# Altium schematic sheet 48MHz_TCXO.SchDoc
size A2; SheetNumber: 2; SheetTotal: 3
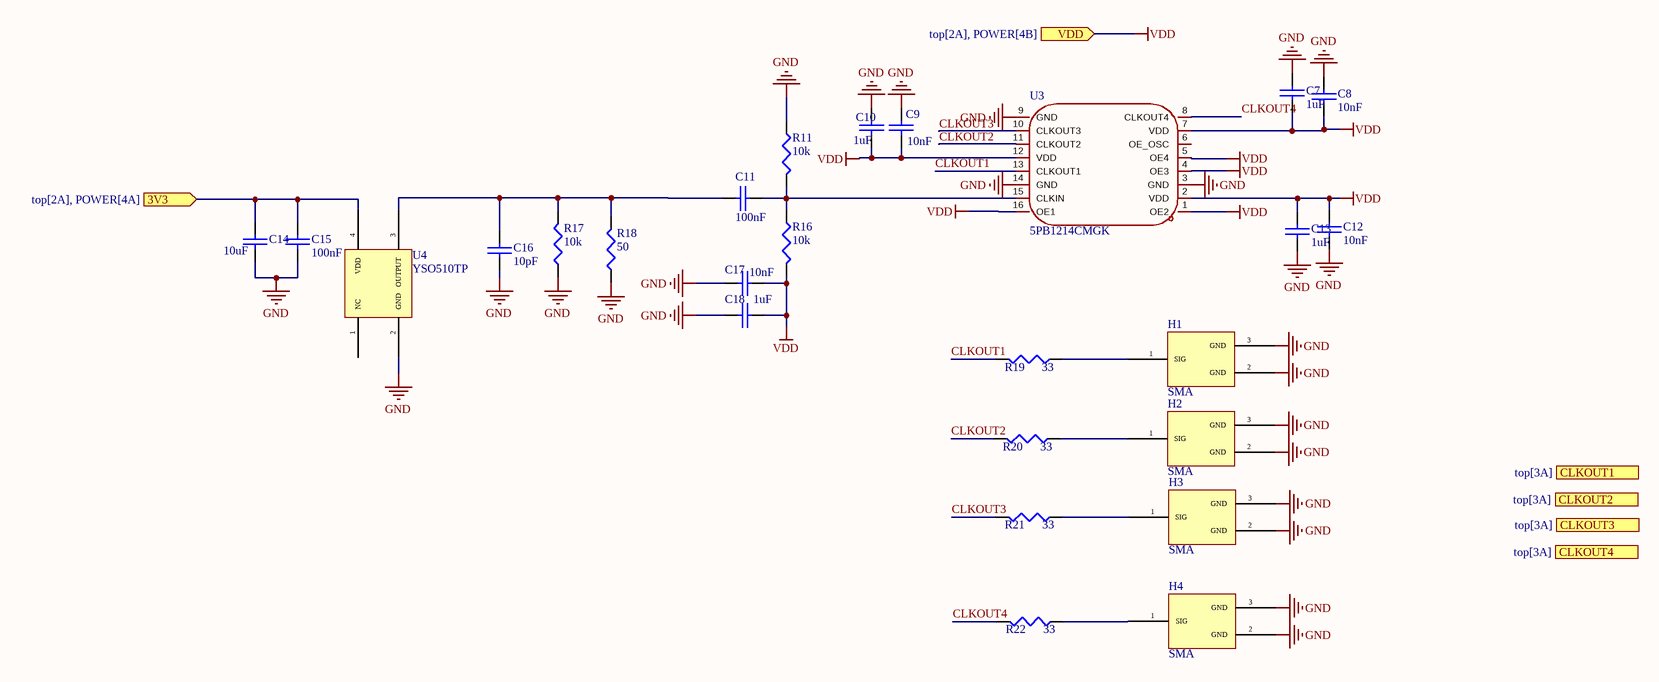
[diagram p0: 48MHz_TCXO.SchDoc]

## Parts
C7  1uF  [0603_Z]
C8  10nF  [0402_Z]
C9  10nF  [0402_Z]
C10  1uF  [0402_Z]
C11  100nF  [0402_Z]
C12  10nF  [0402_Z]
C13  1uF  [0402_Z]
C14  10uF  [0402_Z]
C15  100nF  [0402_Z]
C16  10pF  [0402_Z]
C17  10nF  [0402_Z]
C18  1uF  [0402_Z]
H1  SMA  [SMA-SMD]
H2  SMA  [SMA-SMD]
H3  SMA  [SMA-SMD]
H4  SMA  [SMA-SMD]
R11  10k  [0402_Z]
R16  10k  [0402_Z]
R17  10k  [0402_Z]
R18  50  [0402_Z]
R19  33  [0402_Z]
R20  33  [0402_Z]
R21  33  [0402_Z]
R22  33  [0402_Z]
U3  5PB1214CMGK  [5PB1214CMGK]
U4  YSO510TP  [48MH温补晶振]

## Ports
3V3 (in, see top[2A], POWER[4A]), CLKOUT1 (out, see top[3A]), CLKOUT2 (out, see top[3A]), CLKOUT3 (out, see top[3A]), CLKOUT4 (out, see top[3A]), VDD (in, see top[2A], POWER[4B])

## Nets
GND: C7.2 C8.1 C9.2 C10.1 C12.1 C13.1 C14.1 C15.2 C16.2 C17.2 C18.2 H1.2(GND) H1.3(GND) H2.2(GND) H2.3(GND) H3.2(GND) H3.3(GND) H4.2(GND) H4.3(GND) R11.1 R17.1 R18.1 U3.3(GND) U3.9(GND) U3.14(GND) U4.2(GND)
VDD: C7.1 C8.2 C9.1 C10.2 C12.2 C13.2 C17.1 C18.1 R16.2 U3.1(OE2) U3.2(VDD) U3.4(OE3) U3.5(OE4) U3.7(VDD) U3.12(VDD) U3.16(OE1) ; port VDD
3V3: C14.2 C15.1 U4.4(VDD) ; port 3V3
CLKOUT1: R19.2 U3.13(CLKOUT1)
CLKOUT2: R20.2 U3.11(CLKOUT2)
CLKOUT3: R21.2 U3.10(CLKOUT3)
CLKOUT4: R22.2 U3.8(CLKOUT4)
NetC11_1: C11.1 R11.2 R16.1 U3.15(CLKIN)
NetC11_2: C11.2 C16.1 R17.2 R18.2 U4.3(OUTPUT)
NetH1_1: H1.1(SIG) R19.1
NetH2_1: H2.1(SIG) R20.1
NetH3_1: H3.1(SIG) R21.1
NetH4_1: H4.1(SIG) R22.1

Not connected (* = marked no-connect by the designer): U3 6(OE_OSC); U4 1(NC)

## Library data of the parts
C7-C13 C15-C18 = CAP: 0402; Value: 20pF  NP0
C14 = CAP: 0603; Value: 20pF  NP0
H1-H4 = SMA: BWSMA-KE-P001
R11 R16-R22 = Res3: Resistor; Published: 8-Jun-2000; LatestRevisionDate: 04-Mar-2005; LatestRevisionNote: PCB Footprint replaced.; PackageReference: J1-0603; Publisher: Altium Limited
  R11 R16 R17: Value: 10k
  R18: Value: 50
  R19-R22: Value: 33
U3 = 5PB1214CMGK8
U4 = 48MHz温补晶振